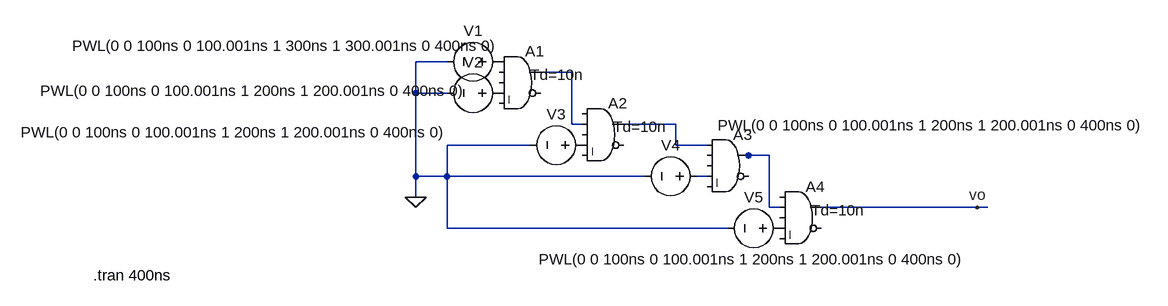
[diagram p0: schematic pro_delay.asc]
pro_delay.asc, the LTspice schematic file:
Version 4.1
SHEET 1 1072 680
WIRE -32 64 -80 64
WIRE 160 80 112 80
WIRE -80 112 -80 64
WIRE -32 112 -80 112
WIRE 160 160 160 80
WIRE 176 160 160 160
WIRE 320 160 240 160
WIRE 96 192 -32 192
WIRE 320 192 320 160
WIRE 368 192 320 192
WIRE 432 208 416 208
WIRE 464 208 432 208
WIRE -80 240 -80 112
WIRE -32 240 -32 192
WIRE -32 240 -80 240
WIRE 272 240 -32 240
WIRE 368 240 352 240
WIRE -80 272 -80 240
WIRE 464 288 464 208
WIRE 480 288 464 288
WIRE 784 288 544 288
WIRE 800 288 784 288
WIRE -32 320 -32 240
WIRE 400 320 -32 320
FLAG -80 272 0
FLAG 784 288 vo
SYMBOL Digital\\and 80 32 R0
WINDOW 3 16 52 Left 2
SYMATTR InstName A1
SYMATTR Value Td=10n
SYMBOL Digital\\and 208 112 R0
WINDOW 3 16 52 Left 2
SYMATTR InstName A2
SYMATTR Value Td=10n
SYMBOL Digital\\and 512 240 R0
WINDOW 3 16 52 Left 2
SYMATTR InstName A4
SYMATTR Value Td=10n
SYMBOL voltage 64 64 R90
WINDOW 0 -32 56 VBottom 2
WINDOW 3 -9 342 VBottom 2
WINDOW 123 0 0 Left 0
WINDOW 39 0 0 Left 0
SYMATTR InstName V1
SYMATTR Value PWL(0 0 100ns 0 100.001ns 1 300ns 1 300.001ns 0 400ns 0)
SYMBOL voltage 64 112 R90
WINDOW 0 -32 56 VBottom 2
WINDOW 3 -19 391 VTop 2
WINDOW 123 0 0 Left 0
WINDOW 39 0 0 Left 0
SYMATTR InstName V2
SYMATTR Value PWL(0 0 100ns 0 100.001ns 1 200ns 1 200.001ns 0 400ns 0)
SYMBOL voltage 368 240 R90
WINDOW 0 -32 56 VBottom 2
WINDOW 3 -94 -347 VTop 2
WINDOW 123 0 0 Left 0
WINDOW 39 0 0 Left 0
SYMATTR InstName V4
SYMATTR Value PWL(0 0 100ns 0 100.001ns 1 200ns 1 200.001ns 0 400ns 0)
SYMBOL voltage 496 320 R90
WINDOW 0 -32 56 VBottom 2
WINDOW 3 32 56 VTop 2
WINDOW 123 0 0 Left 0
WINDOW 39 0 0 Left 0
SYMATTR InstName V5
SYMATTR Value PWL(0 0 100ns 0 100.001ns 1 200ns 1 200.001ns 0 400ns 0)
SYMBOL voltage 192 192 R90
WINDOW 0 -32 56 VBottom 2
WINDOW 3 -35 549 VTop 2
WINDOW 123 0 0 Left 0
WINDOW 39 0 0 Left 0
SYMATTR InstName V3
SYMATTR Value PWL(0 0 100ns 0 100.001ns 1 200ns 1 200.001ns 0 400ns 0)
SYMBOL Digital\\and 400 160 R0
SYMATTR InstName A3
TEXT -576 392 Left 2 !.tran 400ns

The netlist it stands for:
* pro_delay.asc
A1 P001 0 0 P002 0 0 N001 0 AND Td=10n
A2 0 N001 0 P003 0 0 N002 0 AND Td=10n
A4 0 N003 0 P004 0 0 vo 0 AND Td=10n
V1 P001 0 PWL(0 0 100ns 0 100.001ns 1 300ns 1 300.001ns 0 400ns 0)
V2 P002 0 PWL(0 0 100ns 0 100.001ns 1 200ns 1 200.001ns 0 400ns 0)
V4 N004 0 PWL(0 0 100ns 0 100.001ns 1 200ns 1 200.001ns 0 400ns 0)
V5 P004 0 PWL(0 0 100ns 0 100.001ns 1 200ns 1 200.001ns 0 400ns 0)
V3 P003 0 PWL(0 0 100ns 0 100.001ns 1 200ns 1 200.001ns 0 400ns 0)
A3 N002 0 0 N004 0 0 N003 0 AND
.tran 400ns
.backanno
.end